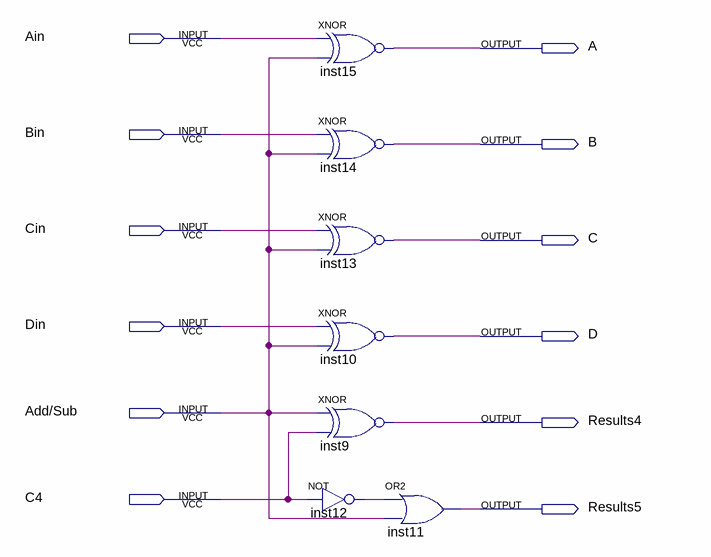
[diagram p0: schematic sheet]
// Quartus schematic Substractor.bdf as structural Verilog: 7 symbols, 12 pins
module Substractor (
  input  Ain,
  input  Bin,
  input  Cin,
  input  Din,
  input  \Add/Sub ,
  input  C4,
  output A,
  output B,
  output C,
  output D,
  output Results4,
  output Results5
);

  wire inst12_out;

  xnor inst15 (A, Ain, \Add/Sub );
  xnor inst14 (B, Bin, \Add/Sub );
  xnor inst13 (C, Cin, \Add/Sub );
  xnor inst10 (D, Din, \Add/Sub );
  xnor inst9 (Results4, \Add/Sub , C4);
  not inst12 (inst12_out, C4);
  or inst11 (Results5, inst12_out, \Add/Sub );
endmodule
